# Altium schematic sheet Controller-Section.SchDoc
size A4; SheetNumber: 5; SheetTotal: 8
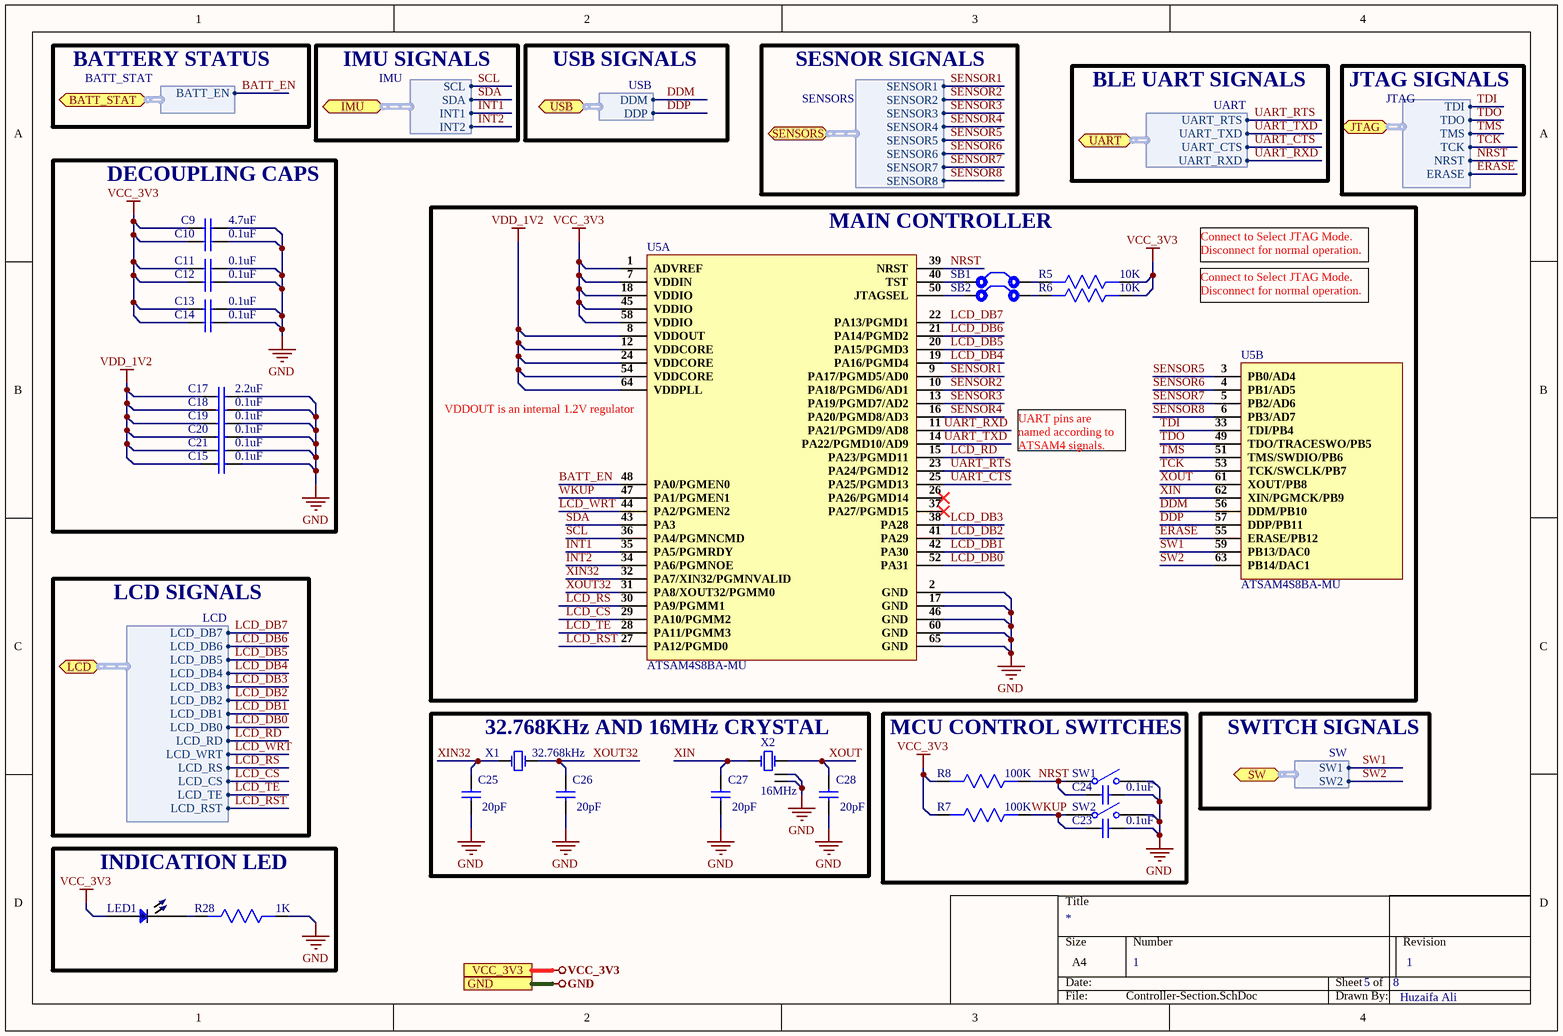
[diagram p0: Controller-Section.SchDoc]

## Parts
C9  4.7uF  [Cap 0402]
C10  0.1uF  [Cap 0402]
C11  0.1uF  [Cap 0402]
C12  0.1uF  [Cap 0402]
C13  0.1uF  [Cap 0402]
C14  0.1uF  [Cap 0402]
C15  0.1uF  [Cap 0402]
C17  2.2uF  [Cap 0402]
C18  0.1uF  [Cap 0402]
C19  0.1uF  [Cap 0402]
C20  0.1uF  [Cap 0402]
C21  0.1uF  [Cap 0402]
C23  0.1uF  [Cap 0402]
C24  0.1uF  [Cap 0402]
C25  20pF  [Cap 0402]
C26  20pF  [Cap 0402]
C27  20pF  [Cap 0402]
C28  20pF  [Cap 0402]
LED1  XZVG68W-2  [LED 0402]  (value not drawn)
R5  10K  [Res0402]
R6  10K  [Res0402]
R7  100K  [Res0402]
R8  100K  [Res0402]
R28  1K  [Res0402]
SB1  Solder Bridge  [Solder Bridge]  (value not drawn)
SB2  Solder Bridge  [Solder Bridge]  (value not drawn)
SW1  TS-1185EC-C-D-B  [TS-1185EC-C-D-B]  (value not drawn)
SW2  TS-1185EC-C-D-B  [TS-1185EC-C-D-B]  (value not drawn)
U5  ATSAM4S8BA-MU  [QFN64]  (parts A,B of 2)
X1  32.768kHz  [X321532768KGD2SI]
X2  16MHz  [X322516MOB4SI]

## Blocks framed on the sheet
DECOUPLING CAPS: C9-C15 C17-C21
MAIN CONTROLLER: R5 R6 SB1 SB2 U5
32.768KHz AND 16MHz CRYSTAL: C25-C28 X1 X2
MCU CONTROL SWITCHES: C23 C24 R7 R8 SW1 SW2
INDICATION LED: LED1 R28

## Ports
BATT_STAT (bidir, harness BATT_STAT), GND, IMU (bidir, harness IMU), JTAG (bidir, harness JTAG), LCD (bidir, harness LCD), SENSORS (bidir, harness SENSORS), SW (bidir, harness SW), UART (bidir, harness UART), USB (bidir, harness USB), VCC_3V3

## Harnesses
IMU: SCL, SDA, INT1, INT2
USB: DDM, DDP
JTAG: TDI, TDO, TMS, TCK, NRST, ERASE
UART: UART_RTS, UART_TXD, UART_CTS, UART_RXD
SENSORS: SENSOR1, SENSOR2, SENSOR3, SENSOR4, SENSOR5, SENSOR6, SENSOR7, SENSOR8
BATT_STAT: BATT_EN
LCD: LCD_DB7, LCD_DB6, LCD_DB5, LCD_DB0, LCD_DB1, LCD_DB2, LCD_DB3, LCD_DB4, LCD_RD, LCD_WRT, LCD_RS, LCD_CS, LCD_TE, LCD_RST
SW: SW1, SW2

## Nets
GND: C9.2 C10.2 C11.2 C12.2 C13.2 C14.2 C15.2 C17.2 C18.2 C19.2 C20.2 C21.2 C23.2 C24.2 C25.1 C26.1 C27.1 C28.1 R28.1 SW1.2 SW2.2 U5.2(GND) U5.17(GND) U5.46(GND) U5.60(GND) U5.65(GND) X2.2(GND) X2.4(GND) ; port GND
VCC_3V3: C9.1 C10.1 C11.1 C12.1 C13.1 C14.1 LED1.1 R5.1 R6.1 R7.2 R8.2 U5.1(ADVREF) U5.7(VDDIN) U5.18(VDDIO) U5.45(VDDIO) U5.58(VDDIO) ; port VCC_3V3
VDD_1V2: C15.1 C17.1 C18.1 C19.1 C20.1 C21.1 U5.8(VDDOUT) U5.12(VDDCORE) U5.24(VDDCORE) U5.54(VDDCORE) U5.64(VDDPLL)
BATT_EN: U5.48(PA0/PGMEN0) ; port BATT_STAT.BATT_EN
DDM: U5.56(DDM/PB10) ; port USB.DDM
DDP: U5.57(DDP/PB11) ; port USB.DDP
ERASE: U5.55(ERASE/PB12) ; port JTAG.ERASE
INT1: U5.35(PA5/PGMRDY) ; port IMU.INT1
INT2: U5.34(PA6/PGMNOE) ; port IMU.INT2
LCD_CS: U5.29(PA10/PGMM2) ; port LCD.LCD_CS
LCD_DB0: U5.52(PA31) ; port LCD.LCD_DB0
LCD_DB1: U5.42(PA30) ; port LCD.LCD_DB1
LCD_DB2: U5.41(PA29) ; port LCD.LCD_DB2
LCD_DB3: U5.38(PA28) ; port LCD.LCD_DB3
LCD_DB4: U5.19(PA16/PGMD4) ; port LCD.LCD_DB4
LCD_DB5: U5.20(PA15/PGMD3) ; port LCD.LCD_DB5
LCD_DB6: U5.21(PA14/PGMD2) ; port LCD.LCD_DB6
LCD_DB7: U5.22(PA13/PGMD1) ; port LCD.LCD_DB7
LCD_RD: U5.15(PA23/PGMD11) ; port LCD.LCD_RD
LCD_RS: U5.30(PA9/PGMM1) ; port LCD.LCD_RS
LCD_RST: U5.27(PA12/PGMD0) ; port LCD.LCD_RST
LCD_TE: U5.28(PA11/PGMM3) ; port LCD.LCD_TE
LCD_WRT: U5.44(PA2/PGMEN2) ; port LCD.LCD_WRT
NRST: C24.1 R8.1 SW1.1 U5.39(NRST) ; port JTAG.NRST
SCL: U5.36(PA4/PGMNCMD) ; port IMU.SCL
SDA: U5.43(PA3) ; port IMU.SDA
SENSOR1: U5.9(PA17/PGMD5/AD0) ; port SENSORS.SENSOR1
SENSOR2: U5.10(PA18/PGMD6/AD1) ; port SENSORS.SENSOR2
SENSOR3: U5.13(PA19/PGMD7/AD2) ; port SENSORS.SENSOR3
SENSOR4: U5.16(PA20/PGMD8/AD3) ; port SENSORS.SENSOR4
SENSOR5: U5.3(PB0/AD4) ; port SENSORS.SENSOR5
SENSOR6: U5.4(PB1/AD5) ; port SENSORS.SENSOR6
SENSOR7: U5.5(PB2/AD6) ; port SENSORS.SENSOR7
SENSOR8: U5.6(PB3/AD7) ; port SENSORS.SENSOR8
SW1: U5.59(PB13/DAC0) ; port SW.SW1
SW2: U5.63(PB14/DAC1) ; port SW.SW2
TCK: U5.53(TCK/SWCLK/PB7) ; port JTAG.TCK
TDI: U5.33(TDI/PB4) ; port JTAG.TDI
TDO: U5.49(TDO/TRACESWO/PB5) ; port JTAG.TDO
TMS: U5.51(TMS/SWDIO/PB6) ; port JTAG.TMS
UART_CTS: U5.25(PA25/PGMD13) ; port UART.UART_CTS
UART_RTS: U5.23(PA24/PGMD12) ; port UART.UART_RTS
UART_RXD: U5.11(PA21/PGMD9/AD8) ; port UART.UART_RXD
UART_TXD: U5.14(PA22/PGMD10/AD9) ; port UART.UART_TXD
WKUP: C23.1 R7.1 SW2.1 U5.47(PA1/PGMEN1)
XIN: C27.2 U5.62(XIN/PGMCK/PB9) X2.1(OSC1)
XIN32: C25.2 U5.32(PA7/XIN32/PGMNVALID) X1.1(OSC1)
XOUT: C28.2 U5.61(XOUT/PB8) X2.3(OSC2)
XOUT32: C26.2 U5.31(PA8/XOUT32/PGMM0) X1.2(OSC2)
NetLED1_2: LED1.2 R28.2
NetR5_2: R5.2 SB1.2
NetR6_2: R6.2 SB2.2
NetSB1_1: SB1.1 U5.40(TST)
NetSB2_1: SB2.1 U5.50(JTAGSEL)

Not connected (* = marked no-connect by the designer): U5 26(PA26/PGMD14)* 37(PA27/PGMD15)*

## Notes on the sheet
- BATTERY STATUS
- IMU SIGNALS
- USB SIGNALS
- SESNOR SIGNALS
- BLE UART SIGNALS
- JTAG SIGNALS
- Connect to Select JTAG Mode. Disconnect for normal operation.
- (near U5) VDDOUT is an internal 1.2V regulator
- UART pins are named according to ATSAM4 signals.
- LCD SIGNALS
- SWITCH SIGNALS
- 1
- Huzaifa Ali

## Library data of the parts
C9 = EDK105BBJ475MVLF: 16V 4.7uF ±20% 0402 Multilayer Ceramic Capacitors MLCC; Manufacturer: Taiyo Yuden; Manufacturer Part Number: EDK105BBJ475MVLF; Footprint: 0402; Value: 4.7uF
C10-C15 C18-C21 C23 C24 = GRM155R71H104ME14D: CAP CER 0.1UF 50V X7R 0402; Manufacturer: Murata; Tolerance: 20%; Capacitance: 100nF; Supplier 1: Digi-Key; Manufacturer Part Number: GRM155R71H104ME14D; Stock 1: 439844; Pricing 1: 1=0.1, 10=0.038, 100=0.0168, 500=0.01198, 1000=0.00941, 2500=0.00855, 5000=0.00787 (USD); Mount: Surface Mount; Case/Package: 0402; Min Operating Temperature: -55°C; Max Operating Temperature: 125°C; Packaging: Cut Tape; Voltage Rating: 50V; Length: 0.039inch; Width: 0.02inch; Thickness: 0.022inch; ComponentLink1URL: http://search.murata.co.jp/Ceramy/image/img/A01X/G101/ENG/GRM155R71H104ME14-01.pdf?src-supplier=Digi-Key; ComponentLink1Description: http://search.murata.co.jp/Ceramy/image/img/A01X/G101/ENG/GRM155R71H104ME14-01.pdf?src-supplier=Digi-Key; ComponentLink2URL: http://psearch.en.murata.com/capacitor/product/GRM155R71H104ME14%23.pdf?src-supplier=Avnet; ComponentLink2Description: http://psearch.en.murata.com/capacitor/product/GRM155R71H104ME14%23.pdf?src-supplier=Avnet; ComponentLink3URL: http://components.arrow.com/part/dataview/0323_07177683?src-supplier=Arrow+Europe; ComponentLink3Description: http://components.arrow.com/part/dataview/0323_07177683?src-supplier=Arrow+Europe; ComponentLink4URL: http://www.mouser.com/ds/2/281/c02e-2905.pdf?src-supplier=Mouser; ComponentLink4Description: http://www.mouser.com/ds/2/281/c02e-2905.pdf?src-supplier=Mouser; Supplier Part Number 1: 490-10701-1-ND
C17 = GRM155R61E225KE11D: CAP CER 2.2UF 25V X5R 0402; Manufacturer: Murata; Manufacturer Part Number: GRM155R61E225KE11D; Footprint: 0402; Value: 2.2uF
C25-C28 = CC0402JRNPO9BN200: CAP CER 20PF 50V C0G/NPO 0402; Manufacturer: Yageo; Tolerance: 5%; Dielectric: C0G; Supplier 1: Digi-Key; Manufacturer Part Number: CC0402JRNPO9BN200; Stock 1: 453493; Pricing 1: 1=0.1, 10=0.036, 100=0.0162, 500=0.01156, 1000=0.00908, 2500=0.00825, 5000=0.00759 (USD); Mount: Surface Mount; Case/Package: 0402; Number of Pins: 2; Weight: 2.3E-05oz; Case Code (Metric): 1005; Case Code (Imperial): 0402; Min Operating Temperature: -55°C; Max Operating Temperature: 125°C; Capacitance: 20pF; Voltage Rating: 50V; Packaging: Tape and Reel; Package Quantity: 1; Voltage Rating (DC): 50V; Termination: SMD/SMT; Composition: Ceramic; Length: 1mm; Width: 0.02inch; Thickness: 0.022inch; Depth: 0.5mm; REACH SVHC: No SVHC; Lead Free: Lead Free; ComponentLink1URL: http://www.yageo.com/documents/recent/UPY-GP_NP0_16V-to-50V_16.pdf?src-supplier=Digi-Key; ComponentLink1Description: http://www.yageo.com/documents/recent/UPY-GP_NP0_16V-to-50V_16.pdf?src-supplier=Digi-Key; ComponentLink2URL: http://www.yageo.com/documents/recent/UPY-GP_NP0_16V-to-50V_16.pdf?src-supplier=Mouser; ComponentLink2Description: http://www.yageo.com/documents/recent/UPY-GP_NP0_16V-to-50V_16.pdf?src-supplier=Mouser; Supplier Part Number 1: 311-1417-1-ND
LED1 = XZVG68W-2: LED GREEN CLEAR CHIP SMD; Manufacturer: SunLED; Lens Color: Colorless; Luminous Intensity: 49mcd; Test Current: 20mA; Viewing Angle: 120°; Dominant Wavelength: 570nm; Forward Voltage: 2.1V; Supplier 1: Digi-Key; Manufacturer Part Number: XZVG68W-2; Stock 1: 4185; Pricing 1: 1=0.5, 10=0.36, 100=0.16, 500=0.112, 1000=0.092 (USD); Mount: Surface Mount; Case/Package: 0402; Color: Green; Case Code (Metric): 1005; Case Code (Imperial): 0402; Packaging: Tape and Reel; Lens Transparency: Clear; Length: 1mm; Height: 0.6mm; Width: 0.5mm; ComponentLink1URL: http://www.sunledusa.com/products/spec/XZVG68W-2.pdf?src-supplier=Digi-Key; ComponentLink1Description: http://www.sunledusa.com/products/spec/XZVG68W-2.pdf?src-supplier=Digi-Key; ComponentLink2URL: https://www.sunledusa.com/products/spec/XZVG68W-2.pdf?src-supplier=Digi-Key; ComponentLink2Description: https://www.sunledusa.com/products/spec/XZVG68W-2.pdf?src-supplier=Digi-Key; Supplier Part Number 1: 1497-1219-6-ND
R5 R6 = RC0402FR-0710KL: RES SMD 10K OHM 1% 1/16W 0402; Manufacturer: Yageo; Resistance: 10kR; Temperature Coefficient: 100ppm/°C; Voltage Rating (DC): 50V; Power Rating: 62.5mW; Supplier 1: Digi-Key; Manufacturer Part Number: RC0402FR-0710KL; Stock 1: 60122563; Pricing 1: 1=0.1, 10=0.016, 100=0.0064, 1000=0.00289, 2500=0.00251, 5000=0.00207 (USD); Case/Package: 0402; Number of Pins: 2; Case Code (Imperial): 0402; Case Code (Metric): 1005; Min Operating Temperature: -55°C; Max Operating Temperature: 155°C; Composition: Thick Film; Tolerance: 1%; Packaging: Tape and Reel; Voltage Rating: 50V; Termination: SMD/SMT; Military Standard: Not; Working Voltage: 50V; Number of Terminations: 2; Length: 1mm; Height: 0.32mm; Width: 0.5mm; Depth: 0.5mm; Lead Pitch: 0.2mm; REACH SVHC: No SVHC; Lead Free: Lead Free; ComponentLink1URL: http://www.farnell.com/datasheets/2167052.pdf?src-supplier=Element14; ComponentLink1Description: http://www.farnell.com/datasheets/2167052.pdf?src-supplier=Element14; ComponentLink2URL: http://www.farnell.com/datasheets/1686128.pdf?src-supplier=Element14; ComponentLink2Description: http://www.farnell.com/datasheets/1686128.pdf?src-supplier=Element14; ComponentLink3URL: http://www.farnell.com/datasheets/1784430.pdf?src-supplier=Element14; ComponentLink3Description: http://www.farnell.com/datasheets/1784430.pdf?src-supplier=Element14; ComponentLink4URL: http://www.yageo.com/documents/recent/PYu-RC_Group_51_RoHS_L_9.pdf?src-supplier=Mouser; ComponentLink4Description: http://www.yageo.com/documents/recent/PYu-RC_Group_51_RoHS_L_9.pdf?src-supplier=Mouser; Supplier Part Number 1: 311-10.0KLRDKR-ND
R7 R8 = ERJPA2F1003X: RES SMD 100K OHM 1% 1/5W 0402; Manufacturer: Panasonic; Manufacturer Part Number: ERJ-PA2F1003X; Resistance: 100kR; Power Rating: 200mW; Voltage Rating: 50V; Temperature Coefficient: 100ppm/°C; Supplier 1: Digi-Key; Stock 1: 8829; Pricing 1: 1=0.21, 10=0.175, 100=0.0686, 1000=0.02871, 2500=0.02632, 5000=0.02393 (USD); Case/Package: 0402; Case Code (Metric): 1005; Case Code (Imperial): 0402; Min Operating Temperature: -55°C; Max Operating Temperature: 155°C; Packaging: Cut Tape; Composition: Thick Film; Number of Terminations: 2; Tolerance: 1%; Max Power Dissipation: 200mW; Voltage Rating (DC): 50V; Features: Automotive AEC-Q200; Length: 0.039inch; Height: 0.016inch; Width: 0.02inch; REACH SVHC: Unknown; ComponentLink1URL: http://www.farnell.com/datasheets/2051174.pdf?src-supplier=Element14; ComponentLink1Description: http://www.farnell.com/datasheets/2051174.pdf?src-supplier=Element14; ComponentLink2URL: https://industrial.panasonic.com/ww/system/files/data/download/catalog/id_fixed-resistors_e_1.pdf?src-supplier=Digi-Key; ComponentLink2Description: https://industrial.panasonic.com/ww/system/files/data/download/catalog/id_fixed-resistors_e_1.pdf?src-supplier=Digi-Key; Supplier Part Number 1: P17236CT-ND
R28 = RC0402JR-071KL: RES 1K OHM 5% 1/16W 0402; Manufacturer: Yageo; Resistance: 1kR; Power Rating: 62.5mW; Voltage Rating: 50V; Temperature Coefficient: 100ppm/°C; Max Power Dissipation: 63mW; Supplier 1: Digi-Key; Manufacturer Part Number: RC0402JR-071KL; RoHS: Yes; Category: Chip SMD Resistors; Stock 1: 452315; Pricing 1: 1=0.10000, 10=0.01300, 100=0.00540, 1000=0.00244, 2500=0.00212, 5000=0.00175 (USD); Case/Package: 0402; Case Code (Imperial): 0402; Case Code (Metric): 1005; Size Code: 0402; Min Operating Temperature: -55°C; Max Operating Temperature: 155°C; Tolerance: 5%; Packaging: Tape and Reel; Package Quantity: 1; Termination: SMD/SMT; Resistor Type: Thick Film; Number of Terminations: 2; Features: Moisture Resistant; Series: RC; Resistance Tolerance: 5%; Construction: Rectangular; Length: 0.039inch; Width: 0.02inch; Height: 0.016inch; Depth: 0.5mm; REACH SVHC: No SVHC; Military Standard: Not; Lead Free: Lead Free; RoHS Compliant: Yes; ComponentLink1URL: https://datasheet.ciiva.com/7983/1018594-7983558.pdf?src-supplier=Element14; ComponentLink1Description: https://datasheet.ciiva.com/7983/1018594-7983558.pdf?src-supplier=Element14; ComponentLink2URL: https://datasheet.ciiva.com/2452/pyu-r-int-thick-7-2452756.pdf?src-supplier=Digi-Key; ComponentLink2Description: https://datasheet.ciiva.com/2452/pyu-r-int-thick-7-2452756.pdf?src-supplier=Digi-Key; ComponentLink3URL: https://datasheet.ciiva.com/2452/pyu-r-int-thick-7-2452757.pdf?src-supplier=Digi-Key; ComponentLink3Description: https://datasheet.ciiva.com/2452/pyu-r-int-thick-7-2452757.pdf?src-supplier=Digi-Key; ComponentLink4URL: https://datasheet.ciiva.com/2452/pyu-r-int-thick-7-2452755.pdf?src-supplier=Digi-Key; ComponentLink4Description: https://datasheet.ciiva.com/2452/pyu-r-int-thick-7-2452755.pdf?src-supplier=Digi-Key; ComponentLink5URL: https://datasheet.ciiva.com/7850/1018594-7850170.pdf?src-supplier=Element14; ComponentLink5Description: https://datasheet.ciiva.com/7850/1018594-7850170.pdf?src-supplier=Element14; ComponentLink6URL: https://datasheet.ciiva.com/7850/1018594-7850171.pdf?src-supplier=Element14; ComponentLink6Description: https://datasheet.ciiva.com/7850/1018594-7850171.pdf?src-supplier=Element14; ComponentLink7URL: https://datasheet.ciiva.com/17081/pyu-rc0402-51-rohs-l-6-r-17081438.pdf?src-supplier=Future+Electronics; ComponentLink7Description: https://datasheet.ciiva.com/17081/pyu-rc0402-51-rohs-l-6-r-17081438.pdf?src-supplier=Future+Electronics; Supplier Part Number 1: 311-1.0KJRCT-ND
SB1 SB2 = Solder Bridge: Solder Bridge ON
SW1 SW2 = TS-1185EC-C-D-B: 3mm 2mm Round Button 50mA Top3.65mm SPST 12V SMD Tactile Switches; Manufacturer: XKB; Manufacturer Part Number: TS-1185EC-C-D-B; Footprint: Custom; ComponentLink1Description: LCSC; ComponentLink1URL: https://lcsc.com/product-detail/Tactile-Switches_XKB-Connectivity-TS-1185EC-C-D-B_C318893.html
U5 = ATSAM4S8BA-MU: IC MCU 32BIT 512KB FLASH 64QFN; Manufacturer: Microchip; Interface: I2C,SPI,USB,IrDA,UART,USART; Peripherals: Brown-out Detect/Reset,POR,PWM,WDT,DMA; Core Architecture: ARM; Frequency: 120MHz; Oscillator Type: Internal; Number of I/Os: 47; Supplier 1: Digi-Key; Manufacturer Part Number: ATSAM4S8BA-MU; RoHS: Yes; Category: Microcontrollers; Pricing 1: 1=6.23000, 25=5.66960, 100=5.13000 (USD); Case/Package: QFN; Min Operating Temperature: -40°C; Max Operating Temperature: 85°C; Memory Type: FLASH; Packaging: Tray; Memory Size: 512KB; RoHS Compliant: Yes; ComponentLink1URL: http://www.microchip.com/mymicrochip/filehandler.aspx?ddocname=en590343&src-supplier=Digi-Key; ComponentLink1Description: http://www.microchip.com/mymicrochip/filehandler.aspx?ddocname=en590343&src-supplier=Digi-Key; Supplier Part Number 1: ATSAM4S8BA-MU-ND
X1 = X321532768KGD2SI: 32.768kHz SMD Crystal Resonator 12.5pF ±20ppm -40℃~+85℃ SMD3215-2P Crystals ROHS; Manufacturer: Yangxing Tech; Manufacturer Part Number: X321532768KGD2SI; Footprint: Custom; ComponentLink1Description: LCSC; ComponentLink1URL: https://www.lcsc.com/product-detail/Crystals_Yangxing-Tech-X321532768KGD2SI_C620155.html
X2 = X322516MOB4SI: 16MHz SMD Crystal Resonator 12pF ±10ppm ±30ppm -40℃~+85℃ SMD3225-4P Crystals ROHS; Manufacturer: Yangxing Tech; Manufacturer Part Number: X322516MOB4SI; Footprint: Custom; ComponentLink1Description: LCSC; ComponentLink1URL: https://www.lcsc.com/product-detail/Crystals_Yangxing-Tech-X322516MOB4SI_C12668.html